# Altium schematic sheet 11.MIPI DSI_CSI.SchDoc
size 297 x 209 mm; SheetNumber: 11; SheetTotal: 13
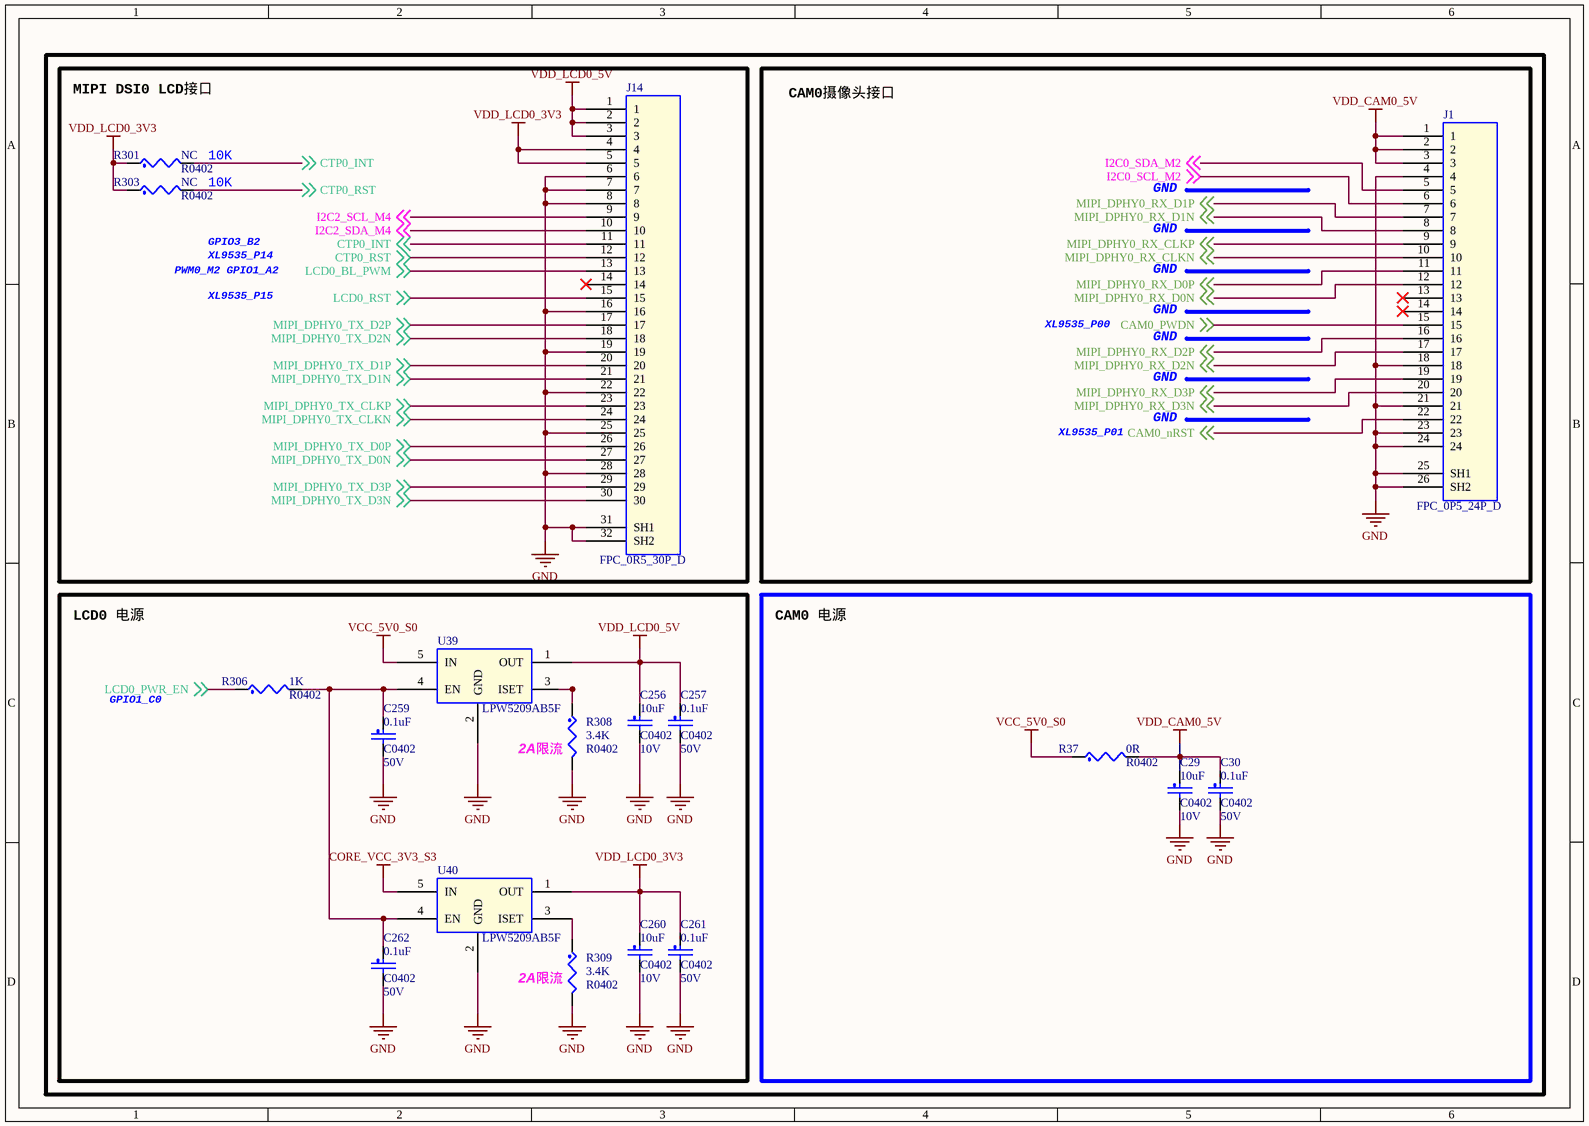
[diagram p0: 11.MIPI DSI_CSI.SchDoc]

## Parts
C29  10uF  Voltage: 10V  [C0402]
C30  0.1uF  Voltage: 50V  [C0402]
C256  10uF  Voltage: 10V  [C0402]
C257  0.1uF  Voltage: 50V  [C0402]
C259  0.1uF  Voltage: 50V  [C0402]
C260  10uF  Voltage: 10V  [C0402]
C261  0.1uF  Voltage: 50V  [C0402]
C262  0.1uF  Voltage: 50V  [C0402]
J1  FPC_0P5_24P_D  [fpc_24p_0p5]
J14  FPC_0R5_30P_D  [FPC-30P-0P5]
R37  0R  [R0402]
R301  NC  [R0402]
R303  NC  [R0402]
R306  1K  [R0402]
R308  3.4K  [R0402]
R309  3.4K  [R0402]
U39  LPW5209AB5F  [SOT23-5]
U40  LPW5209AB5F  [SOT23-5]

## Blocks framed on the sheet
MIPI DSI0 LCD接口: J14 R301 R303
CAM0摄像头接口: J1
LCD0 电源: C256 C257 C259-C262 R306 R308 R309 U39 U40
CAM0 电源: C29 C30 R37

## Nets
CORE_VCC_3V3_S3: U40.5(IN)
GND: C29.2 C30.2 C256.2 C257.2 C259.2 C260.2 C261.2 C262.2 J1.4 J1.18 J1.21 J1.23 J1.24 J1.25(SH1) J1.26(SH2) J14.6 J14.7 J14.8 J14.16 J14.19 J14.22 J14.25 J14.28 J14.31(SH1) J14.32(SH2) R308.2 R309.2 U39.2(GND) U40.2(GND)
VCC_5V0_S0: R37.1 U39.5(IN)
VDD_CAM0_5V: C29.1 C30.1 J1.1 J1.2 J1.3 R37.2
VDD_LCD0_3V3: C260.1 C261.1 J14.4 J14.5 R301.1 R303.1 U40.1(OUT)
VDD_LCD0_5V: C256.1 C257.1 J14.1 J14.2 J14.3 U39.1(OUT)
CAM0_nRST: J1.22 ; off-sheet CAM0_nRST
CAM0_PWDN: J1.15 ; off-sheet CAM0_PWDN
CTP0_INT: J14.11 R301.2 ; off-sheet CTP0_INT
CTP0_RST: J14.12 R303.2 ; off-sheet CTP0_RST
I2C0_SCL_M2: J1.6 ; off-sheet I2C0_SCL_M2
I2C0_SDA_M2: J1.5 ; off-sheet I2C0_SDA_M2
I2C2_SCL_M4: J14.9 ; off-sheet I2C2_SCL_M4
I2C2_SDA_M4: J14.10 ; off-sheet I2C2_SDA_M4
LCD0_BL_PWM: J14.13 ; off-sheet LCD0_BL_PWM
LCD0_PWR_EN: R306.1 ; off-sheet LCD0_PWR_EN
LCD0_RST: J14.15 ; off-sheet LCD0_RST
MIPI_DPHY0_RX_CLKN: J1.10 ; off-sheet MIPI_DPHY0_RX_CLKN
MIPI_DPHY0_RX_CLKP: J1.9 ; off-sheet MIPI_DPHY0_RX_CLKP
MIPI_DPHY0_RX_D0N: J1.12 ; off-sheet MIPI_DPHY0_RX_D0N
MIPI_DPHY0_RX_D0P: J1.11 ; off-sheet MIPI_DPHY0_RX_D0P
MIPI_DPHY0_RX_D1N: J1.8 ; off-sheet MIPI_DPHY0_RX_D1N
MIPI_DPHY0_RX_D1P: J1.7 ; off-sheet MIPI_DPHY0_RX_D1P
MIPI_DPHY0_RX_D2N: J1.17 ; off-sheet MIPI_DPHY0_RX_D2N
MIPI_DPHY0_RX_D2P: J1.16 ; off-sheet MIPI_DPHY0_RX_D2P
MIPI_DPHY0_RX_D3N: J1.20 ; off-sheet MIPI_DPHY0_RX_D3N
MIPI_DPHY0_RX_D3P: J1.19 ; off-sheet MIPI_DPHY0_RX_D3P
MIPI_DPHY0_TX_CLKN: J14.24 ; off-sheet MIPI_DPHY0_TX_CLKN
MIPI_DPHY0_TX_CLKP: J14.23 ; off-sheet MIPI_DPHY0_TX_CLKP
MIPI_DPHY0_TX_D0N: J14.27 ; off-sheet MIPI_DPHY0_TX_D0N
MIPI_DPHY0_TX_D0P: J14.26 ; off-sheet MIPI_DPHY0_TX_D0P
MIPI_DPHY0_TX_D1N: J14.21 ; off-sheet MIPI_DPHY0_TX_D1N
MIPI_DPHY0_TX_D1P: J14.20 ; off-sheet MIPI_DPHY0_TX_D1P
MIPI_DPHY0_TX_D2N: J14.18 ; off-sheet MIPI_DPHY0_TX_D2N
MIPI_DPHY0_TX_D2P: J14.17 ; off-sheet MIPI_DPHY0_TX_D2P
MIPI_DPHY0_TX_D3N: J14.30 ; off-sheet MIPI_DPHY0_TX_D3N
MIPI_DPHY0_TX_D3P: J14.29 ; off-sheet MIPI_DPHY0_TX_D3P
NetC259_1: C259.1 C262.1 R306.2 U39.4(EN) U40.4(EN)
NetR308_1: R308.1 U39.3(ISET)
NetR309_1: R309.1 U40.3(ISET)

Not connected (* = marked no-connect by the designer): J1 13* 14*; J14 14*

## Notes on the sheet
- 10K
- GND
- GPIO3_B2
- XL9535_P14
- PWM0_M2 GPIO1_A2
- XL9535_P15
- XL9535_P00
- XL9535_P01
- GPIO1_C0
- 2A限流

## Library data of the parts
C29 C260 = CAP_NP: CLASS: DISCRETE; 规格: 贴片电容10uF 20% 10V X5R 0402; 规格编号: CL05A106MP8NUB8; 条码: EBF29060247; 品牌: 三星; 类别: 贴片电容0402; 规格书: 三星电容.pdf; 价格: 0.518415; 生命周期: 量产; PCB Footprint: C0402
C30 C261 C262 = CAP_NP: CLASS: DISCRETE; 生命周期: 量产; 价格: 0.029826; 规格书: 风华电容.pdf; 类别: 贴片电容0402; 品牌: 风华; 条码: EBF29060118; 规格编号: 0402X104K500NT; 规格: 贴片电容0.1uF 10% 50V X5R 0402; PCB Footprint: C0402
C256 = CAP_NP: CLASS: DISCRETE; 生命周期: 量产; 价格: 0.518415; 规格书: 三星电容.pdf; 类别: 贴片电容0402; 品牌: 三星; 条码: EBF29060247; 规格编号: CL05A106MP8NUB8; 规格: 贴片电容10uF 20% 10V X5R 0402; PCB Footprint: C0402
C257 C259 = CAP_NP: CLASS: DISCRETE; 规格: 贴片电容0.1uF 10% 50V X5R 0402; 规格编号: 0402X104K500NT; 条码: EBF29060118; 品牌: 风华; 类别: 贴片电容0402; 规格书: 风华电容.pdf; 价格: 0.029826; 生命周期: 量产; PCB Footprint: C0402
J1 = FPC-24P: 规格: FPC连接器 针脚数24 间距0.5mmm 下接 卧贴 翻盖式; 规格编号: AFC01-S24FCA-00; 条码: EBF29040059; 品牌: 钜硕电子; 类别: FPC连接器; 规格书: 钜硕电子-FPC间距0.5mm.pdf; 价格: 0.368739; 生命周期: 量产; PCB Footprint: fpc_24p_0p5; 可替代料: EBF29040059
J14 = FPC-30P: 规格: FPC连接器 针脚数30 间距0.5mm 高度2.0mm 下接 卧贴 翻盖式; 规格编号: FPC-05F-30PH20; 条码: EBF29040079; 品牌: 讯普; 类别: FPC连接器; 规格书: FPC-05F-NPH20.pdf; 生命周期: 量产; PCB Footprint: FPC-30P-0P5
R37 = RES: CLASS: DISCRETE; 生命周期: 量产; 规格书: 合科泰-RI系列电阻.pdf; 类别: 贴片电阻0402; 品牌: 合科泰; 条码: EBF29070049; 规格编号: RI0402L000FT; 规格: 贴片电阻0R 1% 1/16W 0402; PCB Footprint: R0402
R301 R303 = RES: CLASS: DISCRETE; 类别: 贴片电阻0402; 条码: EBF29070087; 规格: 贴片电阻NC 预留; PCB Footprint: R0402
R306 = RES: CLASS: DISCRETE; 规格: 贴片电阻1K 1% 1/16W 0402; 规格编号: RI0402L1001FT; 条码: EBF29070050; 品牌: 合科泰; 类别: 贴片电阻0402; 规格书: 合科泰-RI系列电阻.pdf; 生命周期: 量产; PCB Footprint: R0402
R308 = RES: CLASS: DISCRETE; 规格: 贴片电阻3.4K 1% 1/16W 0402; 规格编号: RI0402L3401FT; 条码: EBF29070186; 品牌: 合科泰; 类别: 贴片电阻0402; 规格书: 合科泰-RI系列电阻.pdf; 生命周期: 量产; PCB Footprint: R0402
R309 = RES: CLASS: DISCRETE; 生命周期: 量产; 规格书: 合科泰-RI系列电阻.pdf; 类别: 贴片电阻0402; 品牌: 合科泰; 条码: EBF29070186; 规格编号: RI0402L3401FT; 规格: 贴片电阻3.4K 1% 1/16W 0402; PCB Footprint: R0402
U39 U40 = LPW5209AB5F: 生命周期: 量产; 价格: 0.468063; 规格书: 微源半导体_LPW5209AB5F.pdf; 类别: 功率开关; 品牌: 微源半导体; 条码: EBF29280015; 规格: 集成电源开关 导通电阻：80mΩ 最大可设置保护电流：2.1A 输入电压：2.5V~6V 静态电流：30uA 其他功能：软启动、短路保护、热保护; PCB Footprint: SOT23-5; 规格编号: LPW5209AB5F